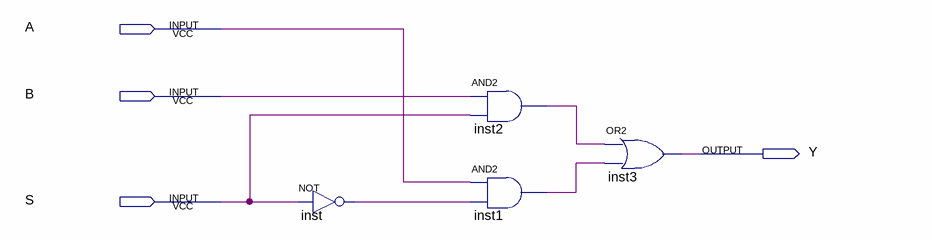
[diagram p0: schematic sheet]
// Quartus schematic mux2_1_ab.bdf as structural Verilog: 4 symbols, 4 pins
module mux2_1_ab (
  input  A,
  input  B,
  input  S,
  output Y
);

  wire inst1_out, inst2_out, inst_out;

  not inst (inst_out, S);
  and inst2 (inst2_out, B, S);
  and inst1 (inst1_out, A, inst_out);
  or inst3 (Y, inst2_out, inst1_out);
endmodule
